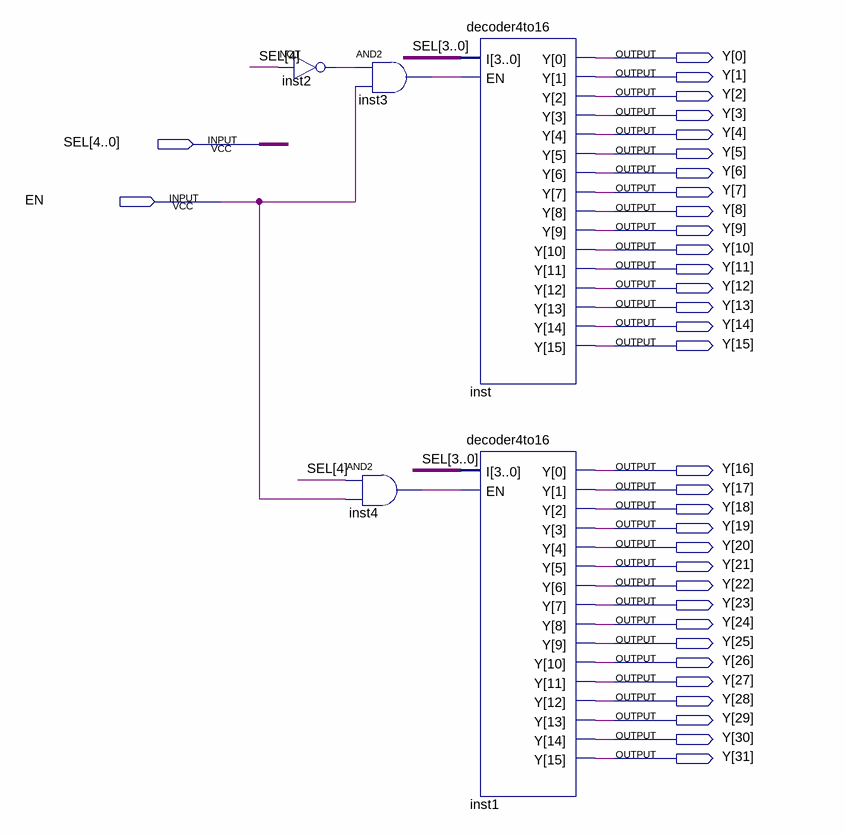
[diagram p0: schematic sheet]
// Quartus schematic decoder5to32.bdf as structural Verilog: 5 symbols, 34 pins
module decoder5to32 (
  input  [4:0] SEL,
  input  EN,
  output [31:0] Y
);

  wire inst2_out, inst3_out, inst4_out;

  not inst2 (inst2_out, SEL[4]);
  and inst3 (inst3_out, inst2_out, EN);
  and inst4 (inst4_out, SEL[4], EN);
  decoder4to16 inst (.I(SEL[3:0]), .EN(inst3_out), .Y(Y[15:0]));
  decoder4to16 inst1 (.I(SEL[3:0]), .EN(inst4_out), .Y(Y[31:16]));
endmodule
